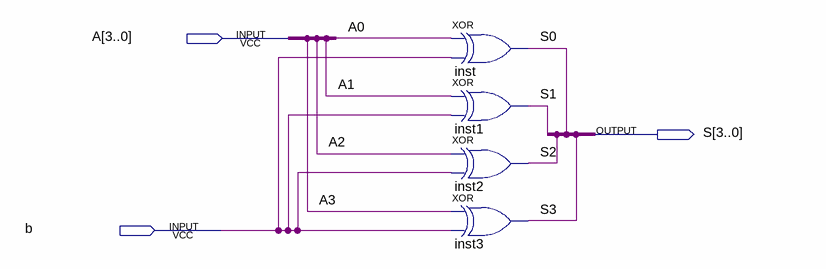
[diagram p0: schematic sheet]
// Quartus schematic xor-arr4.bdf as structural Verilog: 4 symbols, 3 pins
module \xor-arr4  (
  input  [3:0] A,
  input  b,
  output [3:0] S
);

  xor inst (S[0], A[0], b);
  xor inst1 (S[1], A[1], b);
  xor inst2 (S[2], A[2], b);
  xor inst3 (S[3], A[3], b);
endmodule
